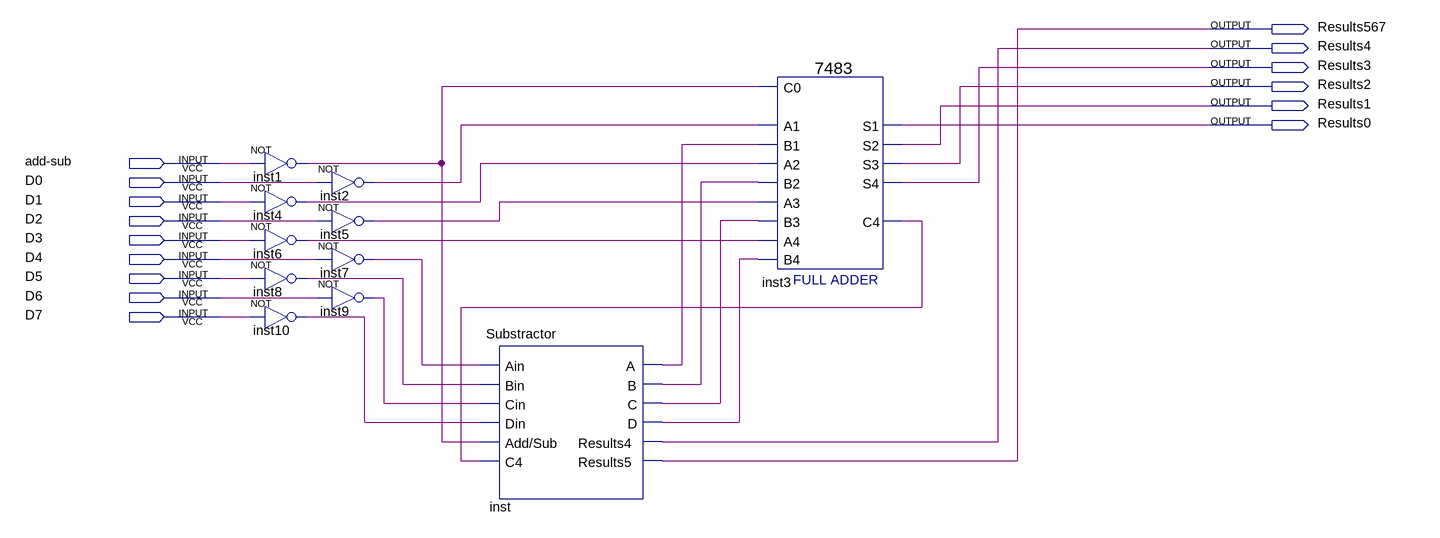
[diagram p0: schematic sheet]
// Quartus schematic add-sub-mod.bdf as structural Verilog: 11 symbols, 15 pins
module \add-sub-mod  (
  input  \add-sub ,
  input  D0,
  input  D1,
  input  D2,
  input  D3,
  input  D4,
  input  D5,
  input  D6,
  input  D7,
  output Results567,
  output Results4,
  output Results3,
  output Results2,
  output Results1,
  output Results0
);

  wire inst1_out, inst2_out, inst3_c4, inst4_out, inst5_out, inst6_out, inst7_out, inst8_out, inst9_out,
       inst10_out, inst_a, inst_b, inst_c, inst_d;

  not inst1 (inst1_out, \add-sub );
  not inst4 (inst4_out, D1);
  not inst6 (inst6_out, D3);
  not inst8 (inst8_out, D5);
  not inst10 (inst10_out, D7);
  not inst2 (inst2_out, D0);
  not inst5 (inst5_out, D2);
  not inst7 (inst7_out, D4);
  not inst9 (inst9_out, D6);
  Substractor inst (
    .Ain(inst7_out), .Bin(inst8_out), .Cin(inst9_out), .Din(inst10_out), .\Add/Sub (inst1_out),
    .C4(inst3_c4), .A(inst_a), .B(inst_b), .C(inst_c), .D(inst_d), .Results4(Results4), .Results5(Results567));
  \7483  inst3 (
    .B4(inst_d), .C0(inst1_out), .A1(inst2_out), .A2(inst4_out), .B1(inst_a), .B2(inst_b), .A3(inst5_out),
    .B3(inst_c), .A4(inst6_out), .S3(Results2), .S4(Results3), .S2(Results1), .C4(inst3_c4), .S1(Results0));
endmodule
